# Altium project Button-Board_v2.0.PrjPcb (part 2 of 2)

## Sheet Power-Sheet.SchDoc
size A4; DocumentNumber: 2; SheetNumber: 2; SheetTotal: 5
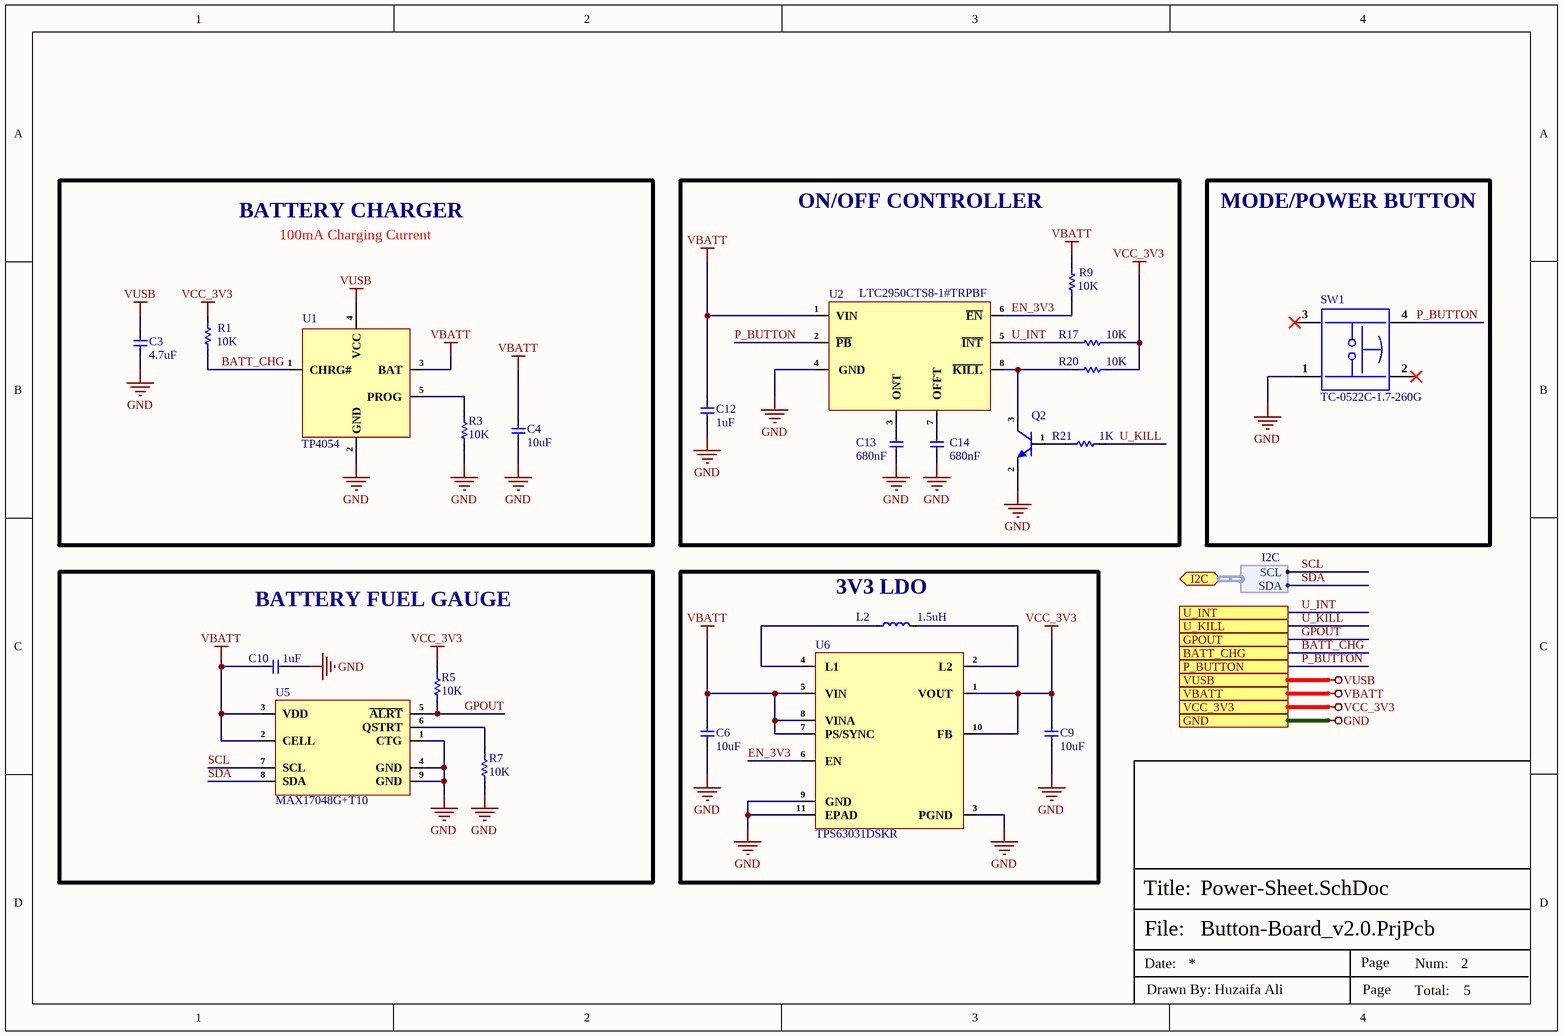
[diagram p4: Power-Sheet.SchDoc]

### Parts
C3  4.7uF  [Cap-0402]
C4  10uF  [Cap-0402]
C6  10uF  [Cap-0402]
C9  10uF  [Cap-0402]
C10  1uF  [Cap-0402]
C12  1uF  [Cap-0402]
C13  680nF  [Cap-0402]
C14  680nF  [Cap-0402]
L2  1.5uH  [LVT303012-1R5M-N]
Q2  MMBT3904T-7-F  [SOT-523]  (value not drawn)
R1  10K  [Res-0402]
R3  10K  [Res-0402]
R5  10K  [Res-0402]
R7  10K  [Res-0402]
R9  10K  [Res-0402]
R17  10K  [Res-0402]
R20  10K  [Res-0402]
R21  1K  [Res-0402]
SW1  TC-0522C-1.7-260G  [TC-0522C-1.7-260G_]
U1  TP4054  [SOT-23-5]
U2  LTC2950CTS8-1#TRPBF  [TSOT-23-8]
U5  MAX17048G+T10  [8-TDFN-EP (2x2)]
U6  TPS63031DSKR  [SON-10-EP(2.5x2.5)]

### Blocks framed on the sheet
BATTERY CHARGER: C3 C4 R1 R3 U1
ON/OFF CONTROLLER: C12-C14 Q2 R9 R17 R20 R21 U2
MODE/POWER BUTTON: SW1
BATTERY FUEL GAUGE: C10 R5 R7 U5
3V3 LDO: C6 C9 L2 U6

### Ports
BATT_CHG (see Top-Sheet[2B], Controller-Sheet[1D]), GND (see Top-Sheet[1B], Connector-Sheet[2D], Controller-Sheet[2D], LED-Driver-Sheet[2D]), GPOUT (see Top-Sheet[2B], Controller-Sheet[1D]), I2C (bidir, harness I2C, see Top-Sheet[2B], Controller-Sheet[1D]), P_BUTTON (see Top-Sheet[2B], Controller-Sheet[1D]), U_INT (see Top-Sheet[2B], Controller-Sheet[1D]), U_KILL (see Top-Sheet[2B], Controller-Sheet[1D]), VBATT (see Top-Sheet[1B], Connector-Sheet[2D], Controller-Sheet[2D], LED-Driver-Sheet[2D]), VCC_3V3 (see Top-Sheet[1B], Controller-Sheet[2D], LED-Driver-Sheet[2D]), VUSB (see Top-Sheet[1B], Connector-Sheet[2D])

### Harnesses
I2C: SDA, SCL

### Nets
GND: C3.1 C4.1 C6.2 C9.2 C10.1 C12.1 C13.1 C14.1 Q2.2(E) R3.1 R7.1 SW1.1 U1.2(GND) U2.4(GND) U5.1(CTG) U5.4(GND) U5.9(GND) U6.3(PGND) U6.9(GND) U6.11(EPAD) ; port GND
VBATT: C4.2 C6.1 C10.2 C12.2 R9.2 U1.3(BAT) U2.1(VIN) U5.2(CELL) U5.3(VDD) U6.5(VIN) U6.7(PS/SYNC) U6.8(VINA) ; port VBATT
VCC_3V3: C9.1 R1.1 R5.1 R17.1 R20.1 U6.1(VOUT) U6.10(FB) ; port VCC_3V3
VUSB: C3.2 U1.4(VCC) ; port VUSB
BATT_CHG: R1.2 U1.1(CHRG#) ; port BATT_CHG
EN_3V3: R9.1 U2.6(~{EN}) U6.6(EN)
GPOUT: R5.2 U5.5(~{ALRT}) ; port GPOUT
P_BUTTON: SW1.4 U2.2(~{PB}) ; port P_BUTTON
SCL: U5.7(SCL) ; port I2C.SCL
SDA: U5.8(SDA) ; port I2C.SDA
U_INT: R17.2 U2.5(~{INT}) ; port U_INT
U_KILL: R21.2 ; port U_KILL
NetC13_2: C13.2 U2.3(ONT)
NetC14_2: C14.2 U2.7(OFFT)
NetL2_1: L2.1 U6.4(L1)
NetL2_2: L2.2 U6.2(L2)
NetQ2_1: Q2.1(B) R21.1
NetQ2_3: Q2.3(C) R20.2 U2.8(~{KILL})
NetR3_2: R3.2 U1.5(PROG)
NetR7_2: R7.2 U5.6(QSTRT)

Not connected (* = marked no-connect by the designer): SW1 2* 3*

### Notes on the sheet
- 100mA Charging Current
- File:
- Title:
- Date:
- Page
- Num:
- Total:
- Drawn By: Huzaifa Ali

### Library data of the parts
C3 = CL05A475MO5NUNC: CAP CER 4.7UF 16V X5R 0402; Manufacturer: Samsung; Material: 4241ConductorMaterial; Tolerance: 20%; Supplier 1: Avnet; Manufacturer Part Number: CL05A475MO5NUNC; RoHS: Yes; Category: Ceramic Capacitors; Stock 1: 50000; Pricing 1: 10000=0.09712 (USD); Mount: Surface Mount; Case/Package: 0402; Case Code (Metric): 1005; Case Code (Imperial): 0402; Min Operating Temperature: -55°C; Max Operating Temperature: 85°C; Packaging: Cut Tape; Capacitance: 4.7uF; Voltage Rating: 16V; Series: CL; Voltage Rating (DC): 16V; Length: 0.039inch; Width: 0.02inch; Height: 550um; Thickness: 0.022inch; RoHS Compliant: Yes; ComponentLink1URL: http://www.farnell.com/datasheets/2710653.pdf?src-supplier=Farnell; ComponentLink1Description: http://www.farnell.com/datasheets/2710653.pdf?src-supplier=Farnell; ComponentLink2URL: http://www.samsungsem.com/kr/support/product-search/mlcc/CL05A475MO5NUNC.jsp?src-supplier=Digikey; ComponentLink2Description: http://www.samsungsem.com/kr/support/product-search/mlcc/CL05A475MO5NUNC.jsp?src-supplier=Digikey; ComponentLink3URL: http://www.farnell.com/datasheets/2710653.pdf?src-supplier=Element14; ComponentLink3Description: http://www.farnell.com/datasheets/2710653.pdf?src-supplier=Element14; ComponentLink4URL: https://datasheet.octopart.com/CL05A475MO5NUNC-Samsung-Electro-Mechanics-datasheet-123102911.pdf?src-supplier=Future+Electronics; ComponentLink4Description: https://datasheet.octopart.com/CL05A475MO5NUNC-Samsung-Electro-Mechanics-datasheet-123102911.pdf?src-supplier=Future+Electronics; ComponentLink5URL: http://www.farnell.com/datasheets/2710653.pdf?src-supplier=Newark; ComponentLink5Description: http://www.farnell.com/datasheets/2710653.pdf?src-supplier=Newark; Supplier Part Number 1: CL05A475MO5NUNC
C4 C6 C9 = CL05A106MP5NUNC: CAP CER 10UF 10V X5R 0402; Manufacturer: Samsung; Tolerance: 20%; Item Type: Capacitor; Supplier 1: Avnet; Manufacturer Part Number: CL05A106MP5NUNC; RoHS: Yes; Category: Ceramic Capacitors; Stock 1: 1729850; Pricing 1: 10000=0.02537 (USD); Mount: Surface Mount; Case/Package: 0402; Case Code (Metric): 1005; Case Code (Imperial): 0402; Contact Plating: Tin; Min Operating Temperature: -55°C; Max Operating Temperature: 85°C; Package Quantity: 1; Packaging: Tape and Reel; Capacitance: 10uF; Voltage Rating: 10V; Dielectric: X5R; Termination: Wraparound; Series: CL; Construction: Flat; Length: 1mm; Width: 0.02inch; Thickness: 0.028inch; Depth: 0.5mm; Radiation Hardening: No; Lead Free: Lead Free; RoHS Compliant: Yes; ComponentLink1URL: https://datasheet.ciiva.com/25721/cl05a106mp5nunc-25721584.pdf?src-supplier=Digi-Key; ComponentLink1Description: https://datasheet.ciiva.com/25721/cl05a106mp5nunc-25721584.pdf?src-supplier=Digi-Key; ComponentLink2URL: https://datasheet.ciiva.com/26838/getdatasheetpartid-745310-26838170.pdf?src-supplier=Verical; ComponentLink2Description: https://datasheet.ciiva.com/26838/getdatasheetpartid-745310-26838170.pdf?src-supplier=Verical; Supplier Part Number 1: CL05A106MP5NUNC; LCSC Part Number: C315248
C10 = CC0402KRX5R7BB105: CAP CER 1UF 16V X5R 0402; Manufacturer: Yageo; Tolerance: 10%; Item Type: Capacitor; Supplier 1: Digi-Key; Manufacturer Part Number: CC0402KRX5R7BB105; Stock 1: 1405667; Pricing 1: 1=0.36, 10=0.252, 100=0.1512, 500=0.1134, 1000=0.09576, 2500=0.09072, 5000=0.08568 (USD); Mount: Surface Mount; Case/Package: 0402; Weight: 2.3E-05oz; Case Code (Imperial): 0402; Case Code (Metric): 1005; Min Operating Temperature: -55°C; Max Operating Temperature: 85°C; Capacitance: 1uF; Dielectric: X5R; Packaging: Tape and Reel; Voltage Rating (DC): 16V; Voltage Rating: 16V; Termination: SMD/SMT; Composition: Ceramic; Length: 1mm; Height: 0.5mm; Width: 0.02inch; Thickness: 0.022inch; Depth: 0.5mm; Radiation Hardening: No; Lead Free: Lead Free; Halogen Free: Halogen Free; ComponentLink1URL: http://www.yageo.com/documents/recent/UPY-GPHC_X5R_4V-to-50V_12.pdf?src-supplier=Avnet+Europe; ComponentLink1Description: http://www.yageo.com/documents/recent/UPY-GPHC_X5R_4V-to-50V_12.pdf?src-supplier=Avnet+Europe; Supplier Part Number 1: 311-1691-6-ND; LCSC Part Number: C325464
C12 = GRM155R61E105KA12D: CAP CER 1UF 25V X5R 0402; Manufacturer: Murata; Material: Ceramic; Tolerance: 10%; Supplier 1: Digi-Key; Manufacturer Part Number: GRM155R61E105KA12D; Stock 1: 1150750; Pricing 1: 1=0.11, 10=0.077, 100=0.0363, 500=0.02546, 1000=0.02108, 2500=0.01962, 5000=0.01795 (USD); Mount: Surface Mount; Case/Package: 0402; Weight: 0.000212oz; Case Code (Metric): 1005; Case Code (Imperial): 0402; Min Operating Temperature: -55°C; Max Operating Temperature: 85°C; Capacitance: 1uF; Voltage Rating: 25V; Packaging: Tape and Reel; Dielectric: X5R; Voltage: 25V; Termination: SMD/SMT; Voltage Rating (DC): 25V; Package Quantity: 10000; Length: 1mm; Height: 0.5mm; Width: 0.5mm; Thickness: 0.022inch; Depth: 0.5mm; REACH SVHC: No SVHC; Lead Free: Lead Free; ComponentLink1URL: http://www.farnell.com/datasheets/2048341.pdf?src-supplier=Element14; ComponentLink1Description: http://www.farnell.com/datasheets/2048341.pdf?src-supplier=Element14; Supplier Part Number 1: 490-10017-6-ND; LCSC Part Number: C77009
C13 C14 = CC0402KRX5R6BB684: CAP CER 0.68UF 10V X5R 0402; Manufacturer: Yageo; Item Type: Capacitor; Material: 4241ConductorMaterial; Temperature Coefficient: 30ppm/°C; Supplier: Digikey; LCSC Part Number: C113784; Manufacturer Part Number: CC0402KRX5R6BB684; RoHS: Yes; Stock: 42168; Pricing: 1=0.12, 10=0.079, 50=0.0474, 100=0.0372, 500=0.0275, 1000=0.02277, 2500=0.0212, 5000=0.01939 (USD); Height: 550um; ComponentLink1URL: http://www.yageo.com/exep/pages/download/literatures/ProductSelectionGuide%202014_Final_2.pdf?src-supplier=Digikey; ComponentLink1Description: http://www.yageo.com/exep/pages/download/literatures/ProductSelectionGuide%202014_Final_2.pdf?src-supplier=Digikey; ComponentLink2URL: http://www.yageo.com/documents/recent/UPY-GPHC_X5R_4V-to-50V_25.pdf?src-supplier=Digikey; ComponentLink2Description: http://www.yageo.com/documents/recent/UPY-GPHC_X5R_4V-to-50V_25.pdf?src-supplier=Digikey; ComponentLink3URL: https://www.yageo.com/upload/media/product/productsearch/datasheet/mlcc/UPY-GPHC_X5R_4V-to-50V_26.pdf?src-supplier=Digikey; ComponentLink3Description: https://www.yageo.com/upload/media/product/productsearch/datasheet/mlcc/UPY-GPHC_X5R_4V-to-50V_26.pdf?src-supplier=Digikey; ComponentLink4URL: https://datasheet.octopart.com/CC0402KRX5R6BB684-Yageo-datasheet-86397281.pdf?src-supplier=Future+Electronics; ComponentLink4Description: https://datasheet.octopart.com/CC0402KRX5R6BB684-Yageo-datasheet-86397281.pdf?src-supplier=Future+Electronics
L2 = LVT303012-1R5M-N: 2.34A 1.5uH Shielded Power Inductors ±20% SMD Power Inductors ROHS; Manufacturer: Chilisin Elec; Manufacturer Part Number: LVT303012-1R5M-N; Package: SMD; LCSC Part Number: C280560; Item Type: Inductor; ComponentLink1Description: LCSC; ComponentLink1URL: https://www.lcsc.com/product-detail/Power-Inductors_Chilisin-Elec-LVT303012-1R5M-N_C280560.html
Q2 = MMBT3904T-7-F: TRANS NPN 40V 0.2A SOT523; Manufacturer: Diodes Zetex; Item Type: Transistor; Supplier: Future Electronics; Supplier Part Number: 4140292; Manufacturer Part Number: MMBT3904T-7-F; RoHS: Yes; Category: BJTs; Stock: 36000; Pricing: 3000=0.0261, 9000=0.0252, 15000=0.0248, 60000=0.0236, 90000=0.0229 (USD); ComponentLink1URL: https://datasheet.ciiva.com/15139/getdatasheetpartid-142850-15139485.pdf?src-supplier=Verical; ComponentLink1Description: https://datasheet.ciiva.com/15139/getdatasheetpartid-142850-15139485.pdf?src-supplier=Verical; ComponentLink2URL: https://datasheet.ciiva.com/11199/ds30270-11199009.pdf?src-supplier=Avnet; ComponentLink2Description: https://datasheet.ciiva.com/11199/ds30270-11199009.pdf?src-supplier=Avnet; ComponentLink3URL: https://datasheet.ciiva.com/17053/0900766b80e49818-17053736.pdf?src-supplier=Allied+Electronics; ComponentLink3Description: https://datasheet.ciiva.com/17053/0900766b80e49818-17053736.pdf?src-supplier=Allied+Electronics; ComponentLink4URL: https://datasheet.ciiva.com/8029/ds30270-8029717.pdf?src-supplier=Element14; ComponentLink4Description: https://datasheet.ciiva.com/8029/ds30270-8029717.pdf?src-supplier=Element14; ComponentLink5URL: https://datasheet.ciiva.com/22711/480146-22711751.pdf?src-supplier=Element14; ComponentLink5Description: https://datasheet.ciiva.com/22711/480146-22711751.pdf?src-supplier=Element14; ComponentLink6URL: https://datasheet.ciiva.com/4723/ds30270-4723401.pdf?src-supplier=Mouser; ComponentLink6Description: https://datasheet.ciiva.com/4723/ds30270-4723401.pdf?src-supplier=Mouser; ComponentLink7URL: https://datasheet.ciiva.com/6360/ds30270-6360919.pdf?src-supplier=Digikey; ComponentLink7Description: https://datasheet.ciiva.com/6360/ds30270-6360919.pdf?src-supplier=Digikey; LCSC Part Number: C239187
R1 = RC0603FR-0710KL: 10 kOhms ±1% 0.063W, 1/16W Chip Resistor 0402 (1005 Metric) Moisture Resistant Thick Film; Manufacturer: YAGEO; Manufacturer Part Number: RC0402FR-0710KL; Digikey Part Number: 311-10.0KLRDKR-ND; Item Type: Resistor; Package: 0402; ComponentLink1Description: Digikey Link; ComponentLink1URL: https://www.digikey.com/en/products/detail/yageo/RC0402FR-0710KL/726523
R3 R5 R7 R9 R17 R20 = RC0402FR-0710KL: RES 10K OHM 1% 1/16W 0402; Manufacturer: Yageo; Resistance: 10kR; Voltage Rating (DC): 50V; Temperature Coefficient: 100ppm/°C; Power Rating: 62.5mW; Max Power Dissipation: 63mW; Item Type: Resistor; Supplier 1: Mouser; Manufacturer Part Number: RC0402FR-0710KL; RoHS: Yes; Category: Chip SMD Resistors; Stock 1: 18648329; Pricing 1: 1=0.10000, 10=0.01400, 50=0.01400, 100=0.00500, 1000=0.00300, 10000=0.00200 (USD); Case/Package: 0402; Number of Pins: 2; Case Code (Imperial): 0402; Case Code (Metric): 1005; Min Operating Temperature: -55°C; Max Operating Temperature: 155°C; Resistor Type: Thick Film; Tolerance: 1%; Packaging: Tape and Reel; Voltage Rating: 50V; Termination: SMD/SMT; Working Voltage: 50V; Number of Terminations: 2; Features: Moisture Resistant; Series: RC; Resistance Tolerance: 1%; Construction: Rectangular; Length: 1mm; Width: 0.5mm; Height: 0.32mm; Depth: 0.5mm; Lead Pitch: 0.2mm; REACH SVHC: No SVHC; Lead Free: Lead Free; RoHS Compliant: Yes; Military Standard: Not; ComponentLink1URL: https://datasheet.ciiva.com/7660/38568-7660787.pdf?src-supplier=Element14; ComponentLink1Description: https://datasheet.ciiva.com/7660/38568-7660787.pdf?src-supplier=Element14; ComponentLink2URL: https://datasheet.ciiva.com/7849/1686128-7849814.pdf?src-supplier=Element14; ComponentLink2Description: https://datasheet.ciiva.com/7849/1686128-7849814.pdf?src-supplier=Element14; ComponentLink3URL: https://datasheet.ciiva.com/7983/1018594-7983486.pdf?src-supplier=Element14; ComponentLink3Description: https://datasheet.ciiva.com/7983/1018594-7983486.pdf?src-supplier=Element14; ComponentLink4URL: https://datasheet.ciiva.com/22747/1018594-22747512.pdf?src-supplier=Element14; ComponentLink4Description: https://datasheet.ciiva.com/22747/1018594-22747512.pdf?src-supplier=Element14; ComponentLink5URL: https://datasheet.ciiva.com/12667/pyu-rc0402-51-rohs-l-6-r-12667067.pdf?src-supplier=Mouser; ComponentLink5Description: https://datasheet.ciiva.com/12667/pyu-rc0402-51-rohs-l-6-r-12667067.pdf?src-supplier=Mouser; ComponentLink6URL: https://datasheet.ciiva.com/7849/1784430-7849813.pdf?src-supplier=Element14; ComponentLink6Description: https://datasheet.ciiva.com/7849/1784430-7849813.pdf?src-supplier=Element14; ComponentLink7URL: https://datasheet.ciiva.com/7849/1784430-7849815.pdf?src-supplier=Element14; ComponentLink7Description: https://datasheet.ciiva.com/7849/1784430-7849815.pdf?src-supplier=Element14; Supplier Part Number 1: 603-RC0402FR-0710KL; LCSC Part Number: C60490
R21 = RC0402FR-071KL: RES 1K OHM 1% 1/16W 0402; Manufacturer: Yageo; Resistance: 1kR; Temperature Coefficient: 100ppm/°C; Voltage Rating (DC): 50V; Power Rating: 62.5mW; Max Power Dissipation: 63mW; Item Type: Resistor; Supplier 1: Avnet; Manufacturer Part Number: RC0402FR-071KL; RoHS: Yes; Category: Chip SMD Resistors; Stock 1: 13030000; Pricing 1: 10000=0.00085, 20000=0.00087, 40000=0.00084, 60000=0.00083, 80000=0.00079, 100000=0.00078, 1000000=0.00076 (USD); Case/Package: 0402; Number of Pins: 2; Case Code (Imperial): 0402; Case Code (Metric): 1005; Size Code: 0402; Min Operating Temperature: -55°C; Max Operating Temperature: 155°C; Resistor Type: Thick Film; Tolerance: 1%; Packaging: Tape and Reel; Voltage Rating: 50V; Termination: SMD/SMT; Features: Moisture Resistant; Series: RC; Number of Terminations: 2; Resistance Tolerance: 1%; Construction: Rectangular; Technology: THICK FILM; Length: 1mm; Width: 0.5mm; Height: 0.32mm; Depth: 0.5mm; Reach SVHC Compliant: Yes; Lead Free: Lead Free; RoHS Compliant: Yes; Military Standard: Not; ComponentLink1URL: https://datasheet.ciiva.com/11819/0900766b80c66297-11819477.pdf?src-supplier=RSComponents; ComponentLink1Description: https://datasheet.ciiva.com/11819/0900766b80c66297-11819477.pdf?src-supplier=RSComponents; ComponentLink2URL: https://datasheet.ciiva.com/7983/1018594-7983502.pdf?src-supplier=Element14; ComponentLink2Description: https://datasheet.ciiva.com/7983/1018594-7983502.pdf?src-supplier=Element14; ComponentLink3URL: https://datasheet.ciiva.com/22747/1018594-22747513.pdf?src-supplier=Element14; ComponentLink3Description: https://datasheet.ciiva.com/22747/1018594-22747513.pdf?src-supplier=Element14; ComponentLink4URL: https://datasheet.ciiva.com/12666/pyu-rc0402-51-rohs-l-6-r-12666741.pdf?src-supplier=Mouser; ComponentLink4Description: https://datasheet.ciiva.com/12666/pyu-rc0402-51-rohs-l-6-r-12666741.pdf?src-supplier=Mouser; ComponentLink5URL: https://datasheet.ciiva.com/7849/1018594-7849869.pdf?src-supplier=Element14; ComponentLink5Description: https://datasheet.ciiva.com/7849/1018594-7849869.pdf?src-supplier=Element14; ComponentLink6URL: https://datasheet.ciiva.com/7849/1018594-7849871.pdf?src-supplier=Element14; ComponentLink6Description: https://datasheet.ciiva.com/7849/1018594-7849871.pdf?src-supplier=Element14; ComponentLink7URL: https://datasheet.ciiva.com/17063/pyu-rc0402-51-rohs-l-6-r-17063193.pdf?src-supplier=Future+Electronics; ComponentLink7Description: https://datasheet.ciiva.com/17063/pyu-rc0402-51-rohs-l-6-r-17063193.pdf?src-supplier=Future+Electronics; Supplier Part Number 1: RC0402FR-071KL; LCSC Part Number: C106235
SW1 = TC-0522C-1.7-260G: No Gull Wing 50mA 100MΩ 80000 260gf@±50gf 12V -25℃~+85℃ 1.7mm Golden Round Button Brick nogging SPST SMD Tactile Switches ROHS; Manufacturer: HCTL; Item Type: Switch; Manufacturer Part Number: TC-0522C-1.7-260G; Value: -; Footprint: Custom; ComponentLink1Description: LCSC; ComponentLink1URL: https://www.lcsc.com/product-detail/Tactile-Switches_HCTL-TC-0522C-1-7-260G_C2845290.html; LCSC Part Number: C2845290
U1 = TP4054: 4.5V~5.5V 锂离子/Polymer 1 600mA SOT-23-5 Battery Management ICs ROHS; Manufacturer: TPOWER; Item Type: IC; Manufacturer Part Number: TP4054; Package: SOT-23-5; LCSC Part Number: C382138; ComponentLink1Description: LCSC; ComponentLink1URL: https://www.lcsc.com/product-detail/Battery-Management-ICs_TPOWER-TP4054_C382138.html
U2 = LTC2950CTS8-1#TRPBF: IC PB ON/OFF CONTROLLER TSOT23-8; Manufacturer: Analog Devices / Linear Technology; Min Input Voltage: 2.7V; Max Supply Voltage: 26.4V; Input Capacitance: 1.5nF; Operating Supply Current: 6uA; Threshold Voltage: 600mV; Supplier: Mouser; LCSC Part Number: C462677; Manufacturer Part Number: LTC2950CTS8-1#TRPBF; RoHS: Yes; Item Type: IC; Stock: 4; Pricing: 1=5.86, 10=4.98, 50=4.98, 100=4.31, 1000=3.1, 10000=2.81 (USD); Case/Package: TSOT; Pins: 8; Min Operating Temperature: 0°C; Max Operating Temperature: 70°C; Package Quantity: 2500; Min Supply Voltage: 2.7V; Packaging: Tape and Reel; Supply Current: 6uA; Length: 2.9mm; Reach SVHC Compliant: No; RoHS Compliant: Yes; ComponentLink1URL: https://datasheet.ciiva.com/1568/1605146-1568809.pdf?src-supplier=Farnell; ComponentLink1Description: https://datasheet.ciiva.com/1568/1605146-1568809.pdf?src-supplier=Farnell; ComponentLink2URL: https://datasheet.ciiva.com/1511/1605146-1511273.pdf?src-supplier=Element14; ComponentLink2Description: https://datasheet.ciiva.com/1511/1605146-1511273.pdf?src-supplier=Element14; ComponentLink3URL: https://datasheet.ciiva.com/1143/1605146-1143882.pdf?src-supplier=Farnell; ComponentLink3Description: https://datasheet.ciiva.com/1143/1605146-1143882.pdf?src-supplier=Farnell; ComponentLink4URL: https://datasheet.ciiva.com/1141/1605146-1141188.pdf?src-supplier=Element14; ComponentLink4Description: https://datasheet.ciiva.com/1141/1605146-1141188.pdf?src-supplier=Element14; ComponentLink5URL: https://datasheet.ciiva.com/25590/1605146-25590575.pdf?src-supplier=Newark; ComponentLink5Description: https://datasheet.ciiva.com/25590/1605146-25590575.pdf?src-supplier=Newark; ComponentLink6URL: https://datasheet.ciiva.com/1967/7377-1967610.pdf?src-supplier=Digikey; ComponentLink6Description: https://datasheet.ciiva.com/1967/7377-1967610.pdf?src-supplier=Digikey
U5 = MAX17048G+T10: IC BATT MON LI-ION 1CELL 8TDFN; Manufacturer: Maxim; Output Voltage: 400mV; Operating Supply Current: 23uA; Operating Supply Voltage: 4.5V; Supplier 1: Mouser; Manufacturer Part Number: MAX17048G+T10; RoHS: Yes; Category: Battery Management; Stock 1: 41293; Pricing 1: 1=3.34000, 10=3.00000, 50=2.84000, 100=2.46000, 1000=1.89000, 10000=1.83000 (USD); Mount: Surface Mount; Number of Pins: 8; Contact Plating: Tin,Matte; Min Operating Temperature: -20°C; Max Operating Temperature: 85°C; Packaging: Tape and Reel; Package Quantity: 10000; Series: ModelGauge™; Radiation Hardening: No; RoHS Compliant: Yes; ComponentLink1URL: https://datasheet.ciiva.com/14083/max17048-max17049-14083973.pdf?src-supplier=Digi-Key; ComponentLink1Description: https://datasheet.ciiva.com/14083/max17048-max17049-14083973.pdf?src-supplier=Digi-Key; Supplier Part Number 1: 700-MAX17048G+T10; LCSC Part Number: C2682616; Item Type: IC
U6 = TPS63031DSKR: IC REG BUCK BST 3.3V 0.9A 10SON; Manufacturer: Texas Instruments; Supplier: Digikey; LCSC Part Number: 296-39461-1-ND; Manufacturer Part Number: TPS63031DSKR; RoHS: Yes; Item Type: IC; Stock: 6304; Pricing: 1=2.06, 10=1.847, 25=1.7424, 100=1.4844, 250=1.3938, 500=1.21958, 1000=1.0105 (USD); ComponentLink1URL: https://datasheet.ciiva.com/2034/tps63030-2034702.pdf?src-supplier=Digikey; ComponentLink1Description: https://datasheet.ciiva.com/2034/tps63030-2034702.pdf?src-supplier=Digikey; ComponentLink2URL: https://datasheet.ciiva.com/3221/tps63030-3221513.pdf?src-supplier=Avnet; ComponentLink2Description: https://datasheet.ciiva.com/3221/tps63030-3221513.pdf?src-supplier=Avnet

## Nets that join several sheets
GND: Connector-Sheet (5 pins), Controller-Sheet (10 pins), LED-Driver-Sheet (7 pins), Power-Sheet (20 pins)
VBATT: Connector-Sheet (J1.2 J2.1), Controller-Sheet (R6.1 R18.1), LED-Driver-Sheet (C8.2 L1.1 U4.5), Power-Sheet (12 pins)
VCC_3V3: Controller-Sheet (7 pins), Power-Sheet (7 pins)
VUSB: Connector-Sheet (J3.2 J3.3), Power-Sheet (C3.2 U1.4)
BATT_CHG: Controller-Sheet (U3.7), Power-Sheet (R1.2 U1.1)
CTRL_SIG: Controller-Sheet (U3.17), LED-Driver-Sheet (R19.2 U4.4)
GPOUT: Controller-Sheet (U3.6), Power-Sheet (R5.2 U5.5)
LED_R_NEG: Connector-Sheet (J1.1), LED-Driver-Sheet (R16.2)
LED_W_NEG: Connector-Sheet (J1.3), LED-Driver-Sheet (R10.2 U4.3)
LED_W_POS: Connector-Sheet (J1.4), LED-Driver-Sheet (C7.2 D1.2)
P_BUTTON: Controller-Sheet (R18.2 U7.2), Power-Sheet (SW1.4 U2.2)
RED_LED: Controller-Sheet (U3.15), LED-Driver-Sheet (R11.1)
SCL: Controller-Sheet (R23.2 U3.14), Power-Sheet (U5.7)
SDA: Controller-Sheet (R22.2 U3.13), Power-Sheet (U5.8)
U_INT: Controller-Sheet (U3.10), Power-Sheet (R17.2 U2.5)
U_KILL: Controller-Sheet (U3.9), Power-Sheet (R21.2)